# Altium schematic sheet PSU.SchDoc
size A3; SheetNumber: 5; SheetTotal: 5
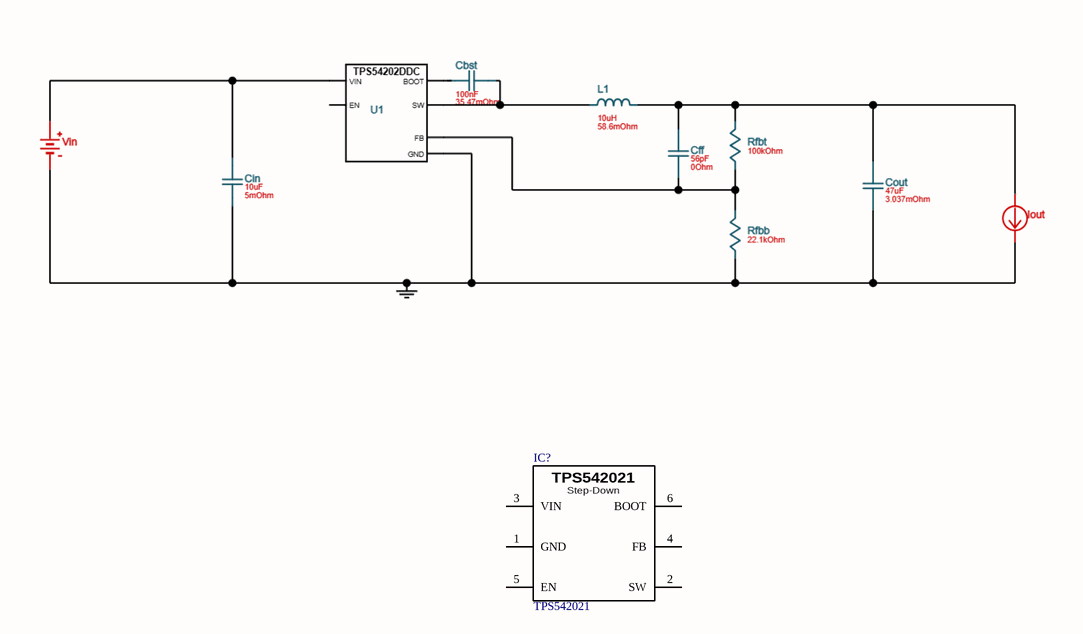
[diagram p0: PSU.SchDoc]

## Parts
IC?  TPS542021  [TSOT-23-6]

## Nets

Not connected (* = marked no-connect by the designer): IC? 1(GND) 2(SW) 3(VIN) 4(FB) 5(EN) 6(BOOT)

## Notes on the sheet
- Project:
- Subsystem:
- Company:
- Document:
- Author:
- Revision:
- Date:
- Sheet:
- /
- (in symbol 070-0010) Step-Down

## Library data of the parts
IC? = 070-0010: Reguladores de tensión de conmutación 4.5V-to-30V input, 2A 500kHz synchronous buck converter; MPN: TPS542021DDCR; Manufacturer: Texas Instruments; ComponentLink1Description: Datasheet; ComponentLink1URL: https://www.ti.com/lit/ds/symlink/tps542021.pdf?ts=1794189706281&ref_url=https%253A%252F%252Fwww.ti.com%252Fsitesearch%252Fen-us%252Fdocs%252Funiversalsearch.tsp%253FlangPref%253Den-US%2526nr%253D7%2526searchTerm%253DTPS542021DDCR; ComponentLink2Description: Distributor Link; ComponentLink2URL: https://www.mouser.es/es/ProductDetail/Texas-Instruments/TPS542021DDCR?qs=dhCoiiGcT1LnO2fomclYkQ%3D%3D; ID: 070-0010; Value: -; Package: TSOT-23-6; Distributor PN: 595-TPS542021DDCR; Distributor: Mouser